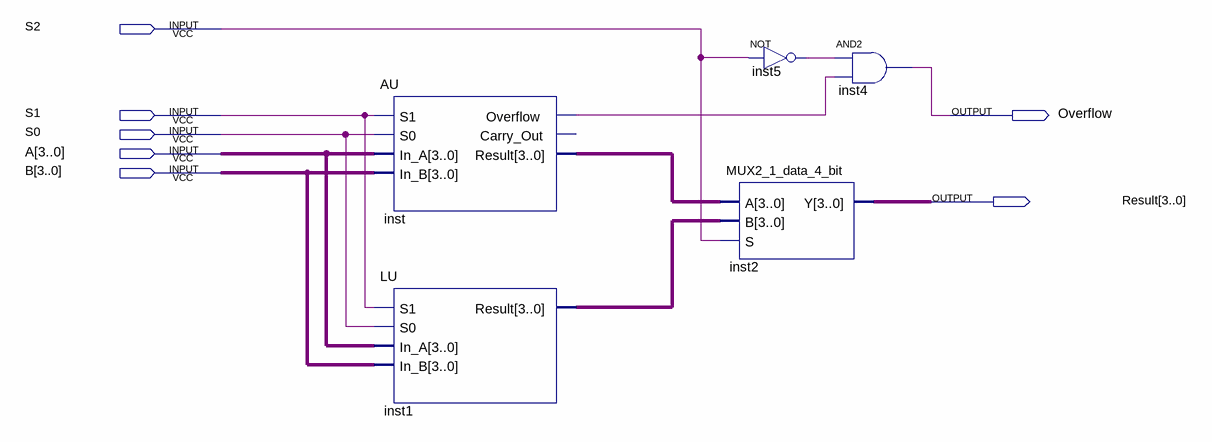
[diagram p0: schematic sheet]
// Quartus schematic ALU.bdf as structural Verilog: 5 symbols, 7 pins
module ALU (
  input  S2,
  input  S1,
  input  S0,
  input  [3:0] A,
  input  [3:0] B,
  output Overflow,
  output [3:0] Result
);

  wire inst5_out, inst_overflow;
  wire [3:0] inst1_result, inst_result;

  AU inst (.S1(S1), .In_A(A), .S0(S0), .In_B(B), .Overflow(inst_overflow), .Result(inst_result));  // open: Carry_Out
  LU inst1 (.S1(S1), .S0(S0), .In_A(A), .In_B(B), .Result(inst1_result));
  MUX2_1_data_4_bit inst2 (.A(inst_result), .B(inst1_result), .S(S2), .Y(Result));
  not inst5 (inst5_out, S2);
  and inst4 (Overflow, inst5_out, inst_overflow);
endmodule
